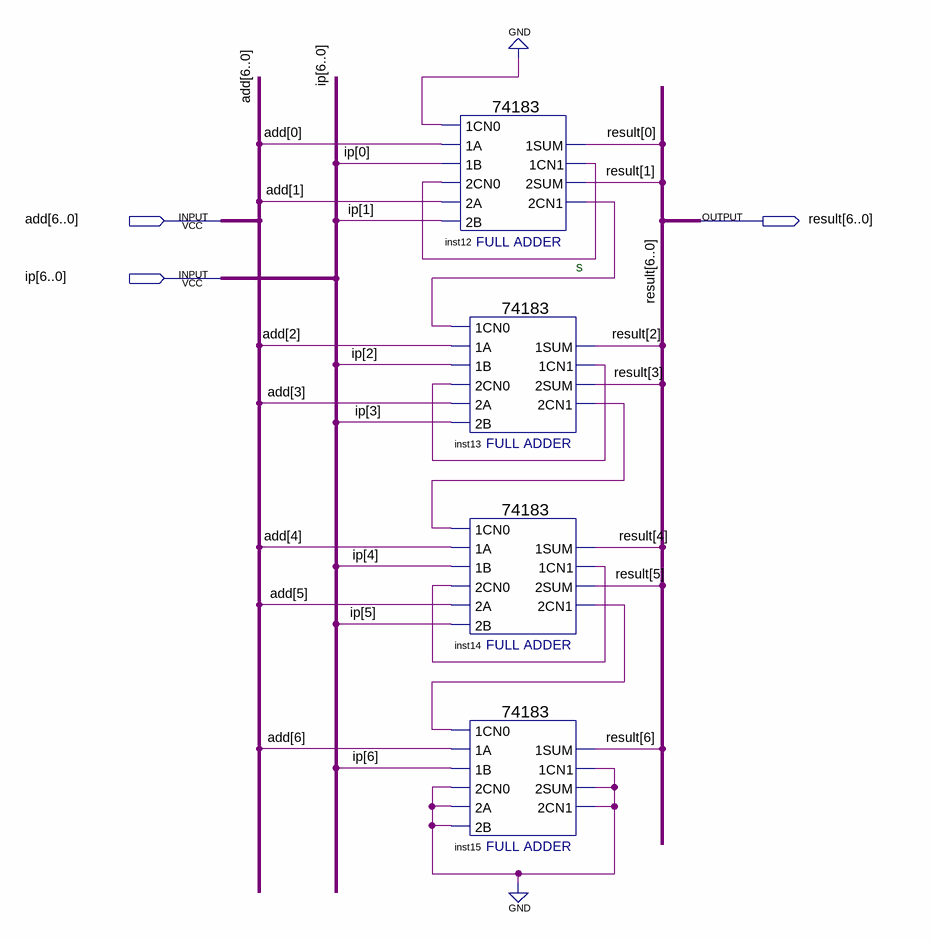
[diagram p0: schematic sheet]
// Quartus schematic bus_adder7.bdf as structural Verilog: 4 symbols, 3 pins
module bus_adder7 (
  input  [6:0] add,
  input  [6:0] ip,
  output [6:0] result
);

  wire inst12_1cn1, inst12_2cn1, inst13_1cn1, inst13_2cn1, inst14_1cn1, inst14_2cn1, inst15_1cn1;

  \74183  inst12 (
    .\2CN0 (inst12_1cn1), .\2A (add[1]), .\1B (ip[0]), .\1A (add[0]), .\2B (ip[1]), .\1CN0 (1'b0),
    .\1CN1 (inst12_1cn1), .\2SUM (result[1]), .\2CN1 (inst12_2cn1), .\1SUM (result[0]));
  \74183  inst13 (
    .\2CN0 (inst13_1cn1), .\2A (add[3]), .\1B (ip[2]), .\1A (add[2]), .\2B (ip[3]), .\1CN0 (inst12_2cn1),
    .\1CN1 (inst13_1cn1), .\2SUM (result[3]), .\2CN1 (inst13_2cn1), .\1SUM (result[2]));
  \74183  inst14 (
    .\2CN0 (inst14_1cn1), .\2A (add[5]), .\1B (ip[4]), .\1A (add[4]), .\2B (ip[5]), .\1CN0 (inst13_2cn1),
    .\1CN1 (inst14_1cn1), .\2SUM (result[5]), .\2CN1 (inst14_2cn1), .\1SUM (result[4]));
  \74183  inst15 (
    .\2CN0 (inst15_1cn1), .\2A (inst15_1cn1), .\1B (ip[6]), .\1A (add[6]), .\2B (inst15_1cn1),
    .\1CN0 (inst14_2cn1), .\1CN1 (inst15_1cn1), .\2SUM (inst15_1cn1), .\2CN1 (inst15_1cn1), .\1SUM (result[6]));
  // also tied to GND on the sheet: inst15_1cn1

  // Notes on the sheet:
  //   s
endmodule
